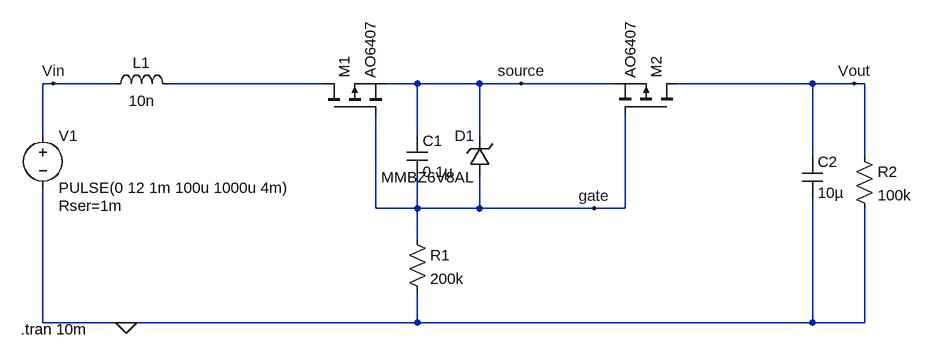
[diagram p0: schematic reverse_protection_and_slow_start.asc]
reverse_protection_and_slow_start.asc, the LTspice schematic file:
Version 4
SHEET 1 964 680
WIRE -368 112 -384 112
WIRE -272 112 -368 112
WIRE 48 112 -192 112
WIRE 192 112 144 112
WIRE 288 112 192 112
WIRE 352 112 288 112
WIRE 496 112 352 112
WIRE 800 112 592 112
WIRE 864 112 800 112
WIRE 880 112 864 112
WIRE -384 192 -384 112
WIRE 192 192 192 112
WIRE 288 192 288 112
WIRE 800 224 800 112
WIRE 880 224 880 112
WIRE 128 304 128 160
WIRE 192 304 192 256
WIRE 192 304 128 304
WIRE 288 304 288 256
WIRE 288 304 192 304
WIRE 464 304 288 304
WIRE 512 304 512 160
WIRE 512 304 464 304
WIRE 192 352 192 304
WIRE -384 480 -384 272
WIRE -256 480 -384 480
WIRE 192 480 192 432
WIRE 192 480 -256 480
WIRE 800 480 800 288
WIRE 800 480 192 480
WIRE 880 480 880 304
WIRE 880 480 800 480
FLAG 864 112 Vout
FLAG -368 112 Vin
FLAG 464 304 gate
FLAG 352 112 source
FLAG -256 480 0
SYMBOL pmos 48 160 R270
SYMATTR InstName M1
SYMATTR Value AO6407
SYMBOL pmos 592 160 M270
SYMATTR InstName M2
SYMATTR Value AO6407
SYMBOL zener 304 256 R180
WINDOW 0 24 64 Left 2
WINDOW 3 24 0 Left 2
SYMATTR InstName D1
SYMATTR Value MMBZ6V8AL
SYMBOL cap 176 192 R0
SYMATTR InstName C1
SYMATTR Value 0.1µ
SYMATTR SpiceLine V=25 Irms=0 Rser=0 Lser=0
SYMBOL res 176 336 R0
SYMATTR InstName R1
SYMATTR Value 200k
SYMBOL voltage -384 176 R0
WINDOW 123 0 0 Left 0
WINDOW 39 24 124 Left 2
SYMATTR InstName V1
SYMATTR Value PULSE(0 12 1m 100u 1000u 4m)
SYMATTR SpiceLine Rser=1m
SYMBOL cap 784 224 R0
SYMATTR InstName C2
SYMATTR Value 10µ
SYMATTR SpiceLine V=25 Irms=0 Rser=0.001 Lser=0
SYMBOL res 864 208 R0
SYMATTR InstName R2
SYMATTR Value 100k
SYMBOL ind -288 128 R270
WINDOW 0 32 56 VTop 2
WINDOW 3 5 56 VBottom 2
SYMATTR InstName L1
SYMATTR Value 10n
SYMATTR SpiceLine Rser=0.001
TEXT -418 490 Left 2 !.tran 10m

The netlist it stands for:
* reverse_protection_and_slow_start.asc
M1 N001 gate source source AO6407
M2 Vout gate source source AO6407
D1 gate source MMBZ6V8AL
C1 source gate 0.1µ V=25 Irms=0 Rser=0 Lser=0
R1 gate 0 200k
V1 Vin 0 PULSE(0 12 1m 100u 1000u 4m) Rser=1m
C2 Vout 0 10µ V=25 Irms=0 Rser=0.001 Lser=0
R2 Vout 0 100k
L1 Vin N001 10n Rser=0.001
.model D D
.lib standard.dio
.model NMOS NMOS
.model PMOS PMOS
.lib standard.mos
.tran 10m
.backanno
.end